# Altium schematic sheet Stepper_Driver_Sheet.SchDoc
size 420 x 297 mm; DocumentNumber: 7; SheetNumber: 7
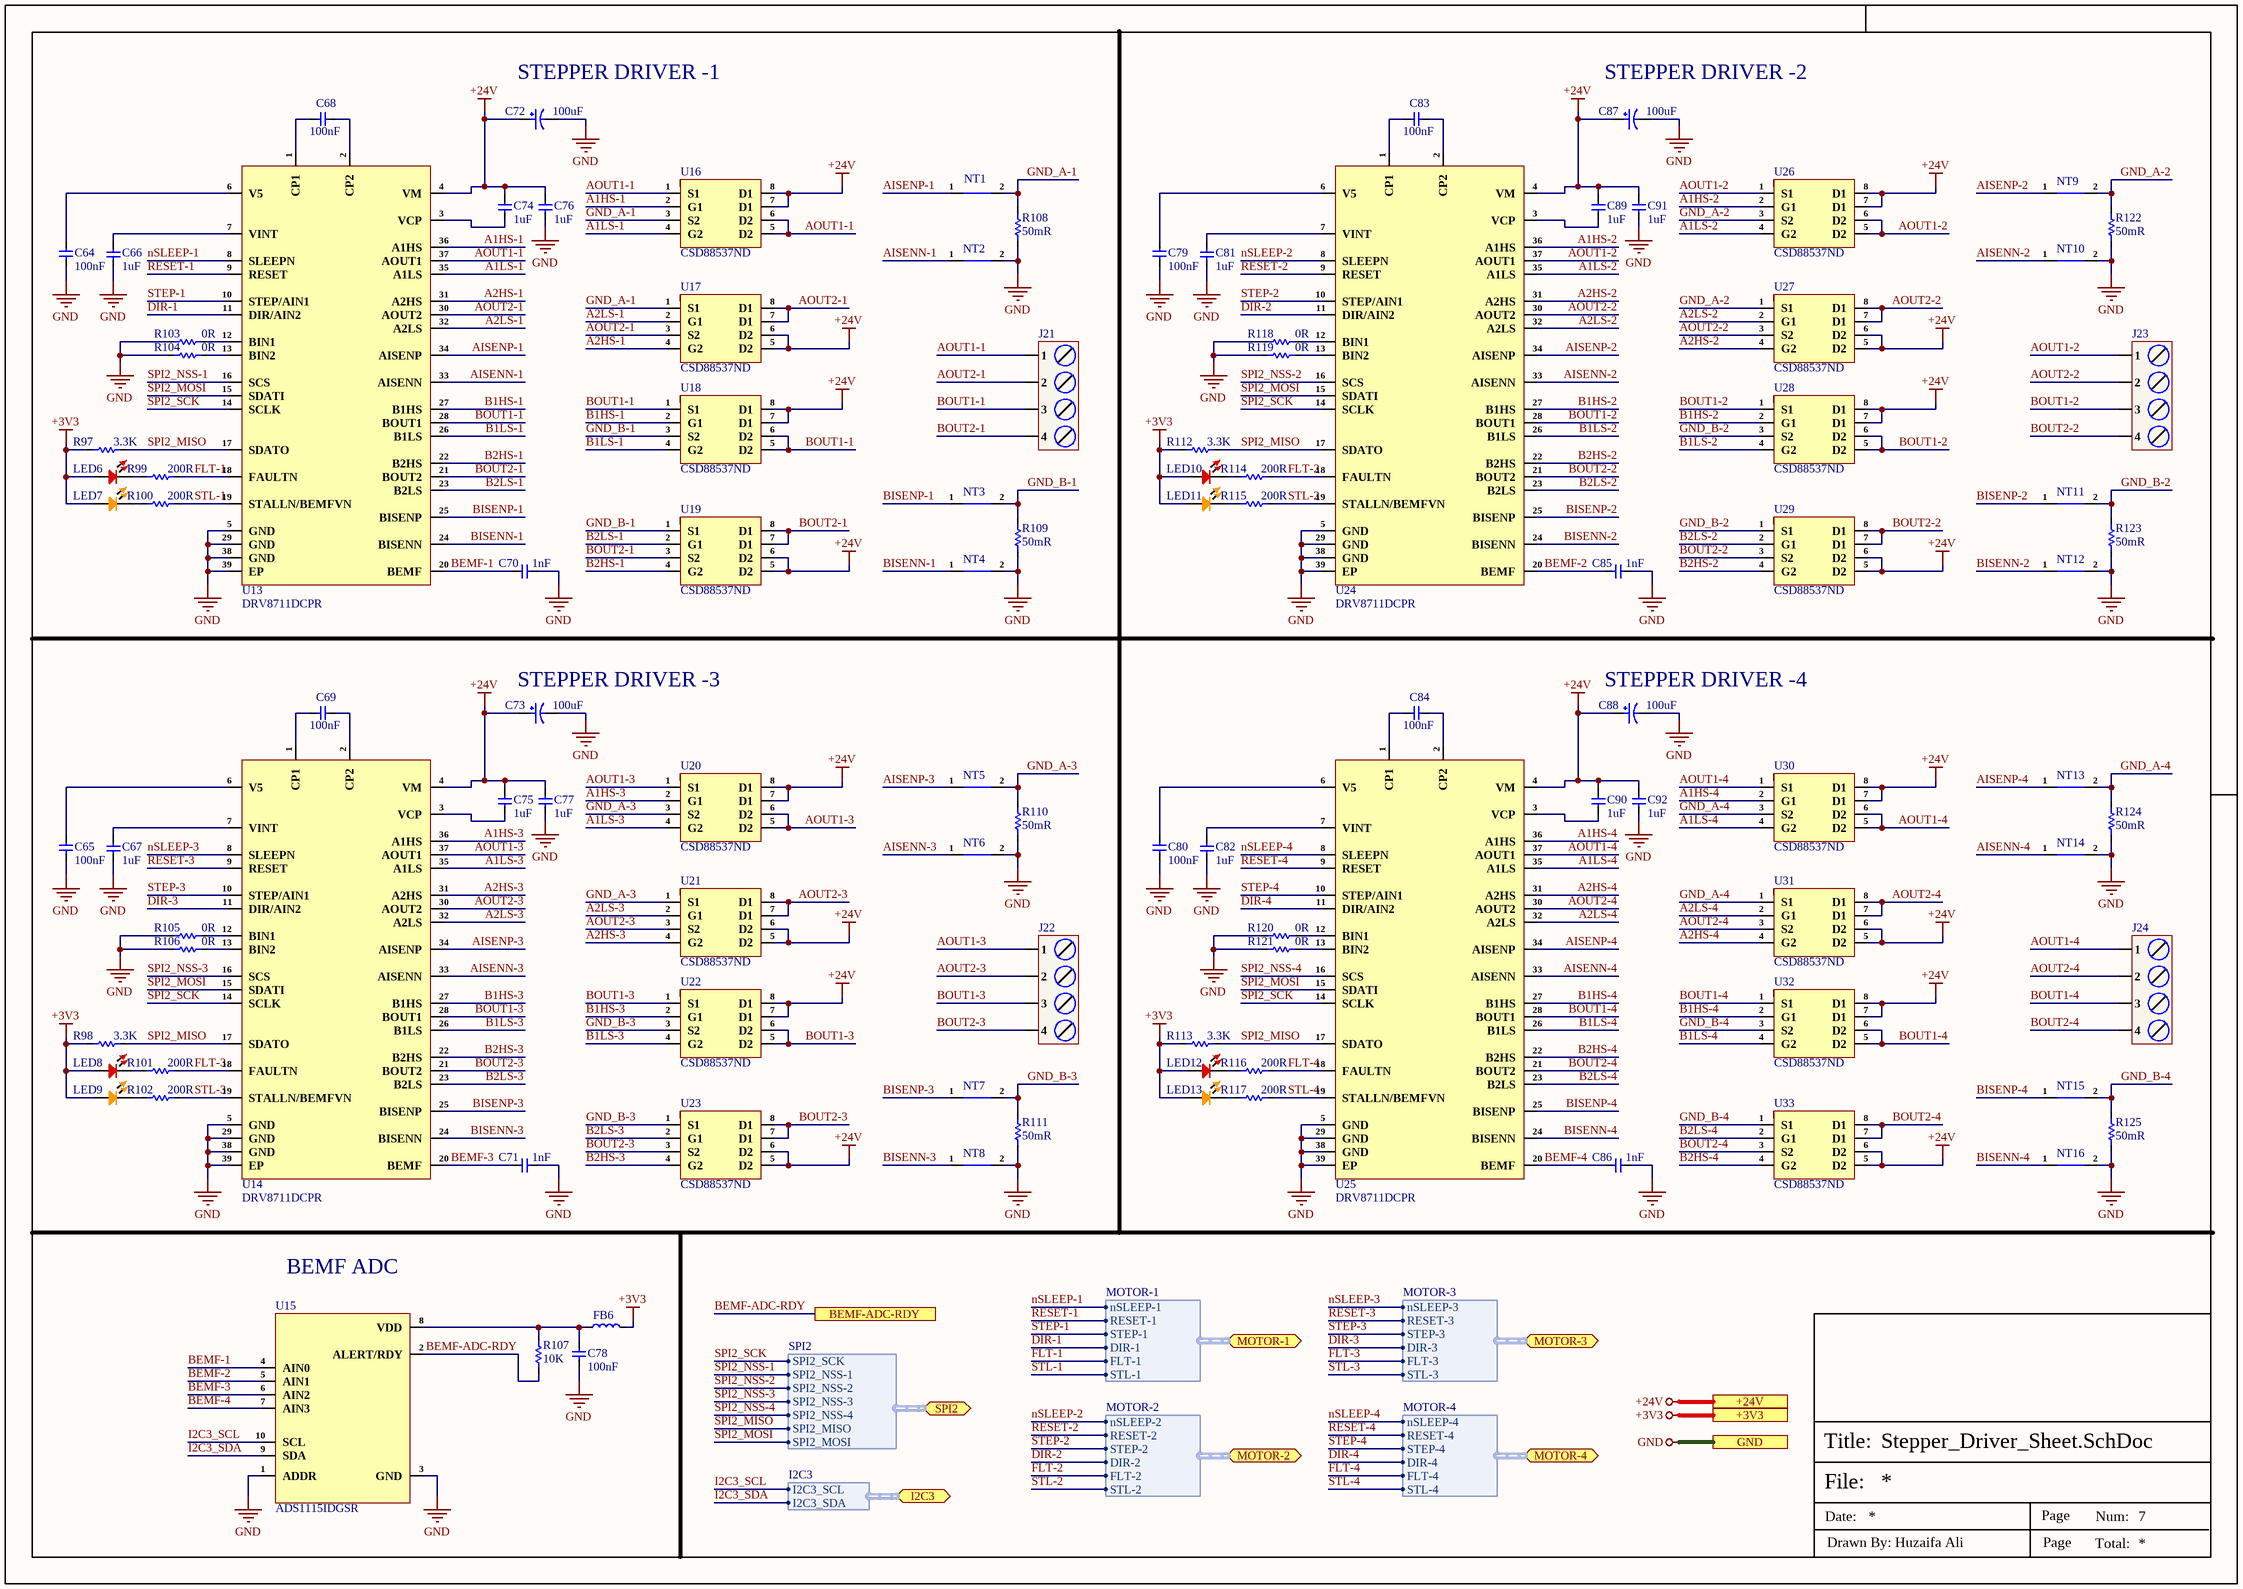
[diagram p0: Stepper_Driver_Sheet.SchDoc]

## Parts
C64  100nF  [cap-0402]
C65  100nF  [cap-0402]
C66  1uF  [Cap-0603]
C67  1uF  [Cap-0603]
C68  100nF  [cap-0402]
C69  100nF  [cap-0402]
C70  1nF  [Cap-0402]
C71  1nF  [Cap-0402]
C72  100uF  [RVT1H101M0607]
C73  100uF  [RVT1H101M0607]
C74  1uF  [Cap-0603]
C75  1uF  [Cap-0603]
C76  1uF  [Cap-0603]
C77  1uF  [Cap-0603]
C78  100nF  [cap-0402]
C79  100nF  [cap-0402]
C80  100nF  [cap-0402]
C81  1uF  [Cap-0603]
C82  1uF  [Cap-0603]
C83  100nF  [cap-0402]
C84  100nF  [cap-0402]
C85  1nF  [Cap-0402]
C86  1nF  [Cap-0402]
C87  100uF  [RVT1H101M0607]
C88  100uF  [RVT1H101M0607]
C89  1uF  [Cap-0603]
C90  1uF  [Cap-0603]
C91  1uF  [Cap-0603]
C92  1uF  [Cap-0603]
FB6  BLM18PG221SN1D  [IND-0603 (1608 Metric)]  (value not drawn)
J21  DB125-3.81-4P-GN-S  [DB125-3.81-4P-GN-S]  (value not drawn)
J22  DB125-3.81-4P-GN-S  [DB125-3.81-4P-GN-S]  (value not drawn)
J23  DB125-3.81-4P-GN-S  [DB125-3.81-4P-GN-S]  (value not drawn)
J24  DB125-3.81-4P-GN-S  [DB125-3.81-4P-GN-S]  (value not drawn)
LED6  RED  [LED-0603]  (value not drawn)
LED7  NCD0603O2  [LED-0603]  (value not drawn)
LED8  RED  [LED-0603]  (value not drawn)
LED9  NCD0603O2  [LED-0603]  (value not drawn)
LED10  RED  [LED-0603]  (value not drawn)
LED11  NCD0603O2  [LED-0603]  (value not drawn)
LED12  RED  [LED-0603]  (value not drawn)
LED13  NCD0603O2  [LED-0603]  (value not drawn)
NT1  Net Tie_SMD  [Net Tie Pad]  (value not drawn)  (net tie, no BOM)
NT2  Net Tie_SMD  [Net Tie Pad]  (value not drawn)  (net tie, no BOM)
NT3  Net Tie_SMD  [Net Tie Pad]  (value not drawn)  (net tie, no BOM)
NT4  Net Tie_SMD  [Net Tie Pad]  (value not drawn)  (net tie, no BOM)
NT5  Net Tie_SMD  [Net Tie Pad]  (value not drawn)  (net tie, no BOM)
NT6  Net Tie_SMD  [Net Tie Pad]  (value not drawn)  (net tie, no BOM)
NT7  Net Tie_SMD  [Net Tie Pad]  (value not drawn)  (net tie, no BOM)
NT8  Net Tie_SMD  [Net Tie Pad]  (value not drawn)  (net tie, no BOM)
NT9  Net Tie_SMD  [Net Tie Pad]  (value not drawn)  (net tie, no BOM)
NT10  Net Tie_SMD  [Net Tie Pad]  (value not drawn)  (net tie, no BOM)
NT11  Net Tie_SMD  [Net Tie Pad]  (value not drawn)  (net tie, no BOM)
NT12  Net Tie_SMD  [Net Tie Pad]  (value not drawn)  (net tie, no BOM)
NT13  Net Tie_SMD  [Net Tie Pad]  (value not drawn)  (net tie, no BOM)
NT14  Net Tie_SMD  [Net Tie Pad]  (value not drawn)  (net tie, no BOM)
NT15  Net Tie_SMD  [Net Tie Pad]  (value not drawn)  (net tie, no BOM)
NT16  Net Tie_SMD  [Net Tie Pad]  (value not drawn)  (net tie, no BOM)
R97  3.3K  [Res-0402]
R98  3.3K  [Res-0402]
R99  200R  [Res-0402]
R100  200R  [Res-0402]
R101  200R  [Res-0402]
R102  200R  [Res-0402]
R103  0R  [Res-0402]
R104  0R  [Res-0402]
R105  0R  [Res-0402]
R106  0R  [Res-0402]
R107  10K  [Res-0402]
R108  50mR  [RES-2010]
R109  50mR  [RES-2010]
R110  50mR  [RES-2010]
R111  50mR  [RES-2010]
R112  3.3K  [Res-0402]
R113  3.3K  [Res-0402]
R114  200R  [Res-0402]
R115  200R  [Res-0402]
R116  200R  [Res-0402]
R117  200R  [Res-0402]
R118  0R  [Res-0402]
R119  0R  [Res-0402]
R120  0R  [Res-0402]
R121  0R  [Res-0402]
R122  50mR  [RES-2010]
R123  50mR  [RES-2010]
R124  50mR  [RES-2010]
R125  50mR  [RES-2010]
U13  DRV8711DCPR  [HTSSOP-38-EP-4.4mm]
U14  DRV8711DCPR  [HTSSOP-38-EP-4.4mm]
U15  ADS1115IDGSR  [VSSOP-10]
U16  CSD88537ND  [SOIC-8]
U17  CSD88537ND  [SOIC-8]
U18  CSD88537ND  [SOIC-8]
U19  CSD88537ND  [SOIC-8]
U20  CSD88537ND  [SOIC-8]
U21  CSD88537ND  [SOIC-8]
U22  CSD88537ND  [SOIC-8]
U23  CSD88537ND  [SOIC-8]
U24  DRV8711DCPR  [HTSSOP-38-EP-4.4mm]
U25  DRV8711DCPR  [HTSSOP-38-EP-4.4mm]
U26  CSD88537ND  [SOIC-8]
U27  CSD88537ND  [SOIC-8]
U28  CSD88537ND  [SOIC-8]
U29  CSD88537ND  [SOIC-8]
U30  CSD88537ND  [SOIC-8]
U31  CSD88537ND  [SOIC-8]
U32  CSD88537ND  [SOIC-8]
U33  CSD88537ND  [SOIC-8]

## Ports
+3V3 (see Top-Sheet[1B], CAN_Sheet[5D], Controller_Sheet[5D], EtherCAT_Sheet[5D], Power_Sheet[5D], RS485_RS232_Sheet[2D]), +24V (see Top-Sheet[1B], Ext_Stepper_Driver_Sheet[5D], Power_Sheet[5D]), BEMF-ADC-RDY (see Top-Sheet[2B], Controller_Sheet[5D]), GND (see Top-Sheet[1B], CAN_Sheet[5D], Controller_Sheet[5D], EtherCAT_Sheet[5D], Ext_Stepper_Driver_Sheet[5D], Power_Sheet[5D], RS485_RS232_Sheet[2D]), I2C3 (bidir, harness I2C3, see Top-Sheet[2B], Controller_Sheet[1C]), MOTOR-1 (bidir, harness MOTOR-1, see Top-Sheet[2B], Controller_Sheet[1D]), MOTOR-2 (bidir, harness MOTOR-2, see Top-Sheet[2B], Controller_Sheet[1D]), MOTOR-3 (bidir, harness MOTOR-3, see Top-Sheet[2B], Controller_Sheet[2D]), MOTOR-4 (bidir, harness MOTOR-4, see Top-Sheet[2B], Controller_Sheet[2D]), SPI2 (bidir, harness SPI2, see Top-Sheet[2B], Controller_Sheet[1D])

## Harnesses
I2C3: I2C3_SCL, I2C3_SDA
SPI2: SPI2_NSS-2, SPI2_NSS-3, SPI2_NSS-4, SPI2_SCK, SPI2_MOSI, SPI2_MISO, SPI2_NSS-1
MOTOR-1: nSLEEP-1, RESET-1, STEP-1, DIR-1, FLT-1, STL-1
MOTOR-2: nSLEEP-2, RESET-2, STEP-2, DIR-2, FLT-2, STL-2
MOTOR-3: nSLEEP-3, RESET-3, STEP-3, DIR-3, FLT-3, STL-3
MOTOR-4: nSLEEP-4, RESET-4, STEP-4, DIR-4, FLT-4, STL-4

## Nets
+3V3: FB6.2 LED6.1 LED7.1 LED8.1 LED9.1 LED10.1 LED11.1 LED12.1 LED13.1 R97.1 R98.1 R112.1 R113.1 ; port +3V3
+24V: C72.1 C73.1 C74.2 C75.2 C76.2 C77.2 C87.1 C88.1 C89.2 C90.2 C91.2 C92.2 U13.4(VM) U14.4(VM) U16.7(D1) U16.8(D1) U17.5(D2) U17.6(D2) U18.7(D1) U18.8(D1) U19.5(D2) U19.6(D2) U20.7(D1) U20.8(D1) U21.5(D2) U21.6(D2) U22.7(D1) U22.8(D1) U23.5(D2) U23.6(D2) U24.4(VM) U25.4(VM) U26.7(D1) U26.8(D1) U27.5(D2) U27.6(D2) U28.7(D1) U28.8(D1) U29.5(D2) U29.6(D2) U30.7(D1) U30.8(D1) U31.5(D2) U31.6(D2) U32.7(D1) U32.8(D1) U33.5(D2) U33.6(D2) ; port +24V
GND: C64.2 C65.2 C66.1 C67.1 C70.2 C71.2 C72.2 C73.2 C76.1 C77.1 C78.2 C79.2 C80.2 C81.1 C82.1 C85.2 C86.2 C87.2 C88.2 C91.1 C92.1 NT2.2 NT4.2 NT6.2 NT8.2 NT10.2 NT12.2 NT14.2 NT16.2 R103.1 R104.1 R105.1 R106.1 R108.1 R109.1 R110.1 R111.1 R118.1 R119.1 R120.1 R121.1 R122.1 R123.1 R124.1 R125.1 U13.5(GND) U13.29(GND) U13.38(GND) U13.39(EP) U14.5(GND) U14.29(GND) U14.38(GND) U14.39(EP) U15.1(ADDR) U15.3(GND) U24.5(GND) U24.29(GND) U24.38(GND) U24.39(EP) U25.5(GND) U25.29(GND) U25.38(GND) U25.39(EP) ; port GND
A1HS-1: U13.36(A1HS) U16.2(G1)
A1HS-2: U24.36(A1HS) U26.2(G1)
A1HS-3: U14.36(A1HS) U20.2(G1)
A1HS-4: U25.36(A1HS) U30.2(G1)
A1LS-1: U13.35(A1LS) U16.4(G2)
A1LS-2: U24.35(A1LS) U26.4(G2)
A1LS-3: U14.35(A1LS) U20.4(G2)
A1LS-4: U25.35(A1LS) U30.4(G2)
A2HS-1: U13.31(A2HS) U17.4(G2)
A2HS-2: U24.31(A2HS) U27.4(G2)
A2HS-3: U14.31(A2HS) U21.4(G2)
A2HS-4: U25.31(A2HS) U31.4(G2)
A2LS-1: U13.32(A2LS) U17.2(G1)
A2LS-2: U24.32(A2LS) U27.2(G1)
A2LS-3: U14.32(A2LS) U21.2(G1)
A2LS-4: U25.32(A2LS) U31.2(G1)
AISENN-1: NT2.1 U13.33(AISENN)
AISENN-2: NT10.1 U24.33(AISENN)
AISENN-3: NT6.1 U14.33(AISENN)
AISENN-4: NT14.1 U25.33(AISENN)
AISENP-1: NT1.1 U13.34(AISENP)
AISENP-2: NT9.1 U24.34(AISENP)
AISENP-3: NT5.1 U14.34(AISENP)
AISENP-4: NT13.1 U25.34(AISENP)
AOUT1-1: J21.1 U13.37(AOUT1) U16.1(S1) U16.5(D2) U16.6(D2)
AOUT1-2: J23.1 U24.37(AOUT1) U26.1(S1) U26.5(D2) U26.6(D2)
AOUT1-3: J22.1 U14.37(AOUT1) U20.1(S1) U20.5(D2) U20.6(D2)
AOUT1-4: J24.1 U25.37(AOUT1) U30.1(S1) U30.5(D2) U30.6(D2)
AOUT2-1: J21.2 U13.30(AOUT2) U17.3(S2) U17.7(D1) U17.8(D1)
AOUT2-2: J23.2 U24.30(AOUT2) U27.3(S2) U27.7(D1) U27.8(D1)
AOUT2-3: J22.2 U14.30(AOUT2) U21.3(S2) U21.7(D1) U21.8(D1)
AOUT2-4: J24.2 U25.30(AOUT2) U31.3(S2) U31.7(D1) U31.8(D1)
B1HS-1: U13.27(B1HS) U18.2(G1)
B1HS-2: U24.27(B1HS) U28.2(G1)
B1HS-3: U14.27(B1HS) U22.2(G1)
B1HS-4: U25.27(B1HS) U32.2(G1)
B1LS-1: U13.26(B1LS) U18.4(G2)
B1LS-2: U24.26(B1LS) U28.4(G2)
B1LS-3: U14.26(B1LS) U22.4(G2)
B1LS-4: U25.26(B1LS) U32.4(G2)
B2HS-1: U13.22(B2HS) U19.4(G2)
B2HS-2: U24.22(B2HS) U29.4(G2)
B2HS-3: U14.22(B2HS) U23.4(G2)
B2HS-4: U25.22(B2HS) U33.4(G2)
B2LS-1: U13.23(B2LS) U19.2(G1)
B2LS-2: U24.23(B2LS) U29.2(G1)
B2LS-3: U14.23(B2LS) U23.2(G1)
B2LS-4: U25.23(B2LS) U33.2(G1)
BEMF-1: C70.1 U13.20(BEMF) U15.4(AIN0)
BEMF-2: C85.1 U15.5(AIN1) U24.20(BEMF)
BEMF-3: C71.1 U14.20(BEMF) U15.6(AIN2)
BEMF-4: C86.1 U15.7(AIN3) U25.20(BEMF)
BEMF-ADC-RDY: R107.2 U15.2(ALERT/RDY) ; port BEMF-ADC-RDY
BISENN-1: NT4.1 U13.24(BISENN)
BISENN-2: NT12.1 U24.24(BISENN)
BISENN-3: NT8.1 U14.24(BISENN)
BISENN-4: NT16.1 U25.24(BISENN)
BISENP-1: NT3.1 U13.25(BISENP)
BISENP-2: NT11.1 U24.25(BISENP)
BISENP-3: NT7.1 U14.25(BISENP)
BISENP-4: NT15.1 U25.25(BISENP)
BOUT1-1: J21.3 U13.28(BOUT1) U18.1(S1) U18.5(D2) U18.6(D2)
BOUT1-2: J23.3 U24.28(BOUT1) U28.1(S1) U28.5(D2) U28.6(D2)
BOUT1-3: J22.3 U14.28(BOUT1) U22.1(S1) U22.5(D2) U22.6(D2)
BOUT1-4: J24.3 U25.28(BOUT1) U32.1(S1) U32.5(D2) U32.6(D2)
BOUT2-1: J21.4 U13.21(BOUT2) U19.3(S2) U19.7(D1) U19.8(D1)
BOUT2-2: J23.4 U24.21(BOUT2) U29.3(S2) U29.7(D1) U29.8(D1)
BOUT2-3: J22.4 U14.21(BOUT2) U23.3(S2) U23.7(D1) U23.8(D1)
BOUT2-4: J24.4 U25.21(BOUT2) U33.3(S2) U33.7(D1) U33.8(D1)
DIR-1: U13.11(DIR/AIN2) ; port MOTOR-1.DIR-1
DIR-2: U24.11(DIR/AIN2) ; port MOTOR-2.DIR-2
DIR-3: U14.11(DIR/AIN2) ; port MOTOR-3.DIR-3
DIR-4: U25.11(DIR/AIN2) ; port MOTOR-4.DIR-4
FLT-1: R99.2 U13.18(FAULTN) ; port MOTOR-1.FLT-1
FLT-2: R114.2 U24.18(FAULTN) ; port MOTOR-2.FLT-2
FLT-3: R101.2 U14.18(FAULTN) ; port MOTOR-3.FLT-3
FLT-4: R116.2 U25.18(FAULTN) ; port MOTOR-4.FLT-4
GND_A-1: NT1.2 R108.2 U16.3(S2) U17.1(S1)
GND_A-2: NT9.2 R122.2 U26.3(S2) U27.1(S1)
GND_A-3: NT5.2 R110.2 U20.3(S2) U21.1(S1)
GND_A-4: NT13.2 R124.2 U30.3(S2) U31.1(S1)
GND_B-1: NT3.2 R109.2 U18.3(S2) U19.1(S1)
GND_B-2: NT11.2 R123.2 U28.3(S2) U29.1(S1)
GND_B-3: NT7.2 R111.2 U22.3(S2) U23.1(S1)
GND_B-4: NT15.2 R125.2 U32.3(S2) U33.1(S1)
I2C3_SCL: U15.10(SCL) ; port I2C3.I2C3_SCL
I2C3_SDA: U15.9(SDA) ; port I2C3.I2C3_SDA
nSLEEP-1: U13.8(SLEEPN) ; port MOTOR-1.nSLEEP-1
nSLEEP-2: U24.8(SLEEPN) ; port MOTOR-2.nSLEEP-2
nSLEEP-3: U14.8(SLEEPN) ; port MOTOR-3.nSLEEP-3
nSLEEP-4: U25.8(SLEEPN) ; port MOTOR-4.nSLEEP-4
RESET-1: U13.9(RESET) ; port MOTOR-1.RESET-1
RESET-2: U24.9(RESET) ; port MOTOR-2.RESET-2
RESET-3: U14.9(RESET) ; port MOTOR-3.RESET-3
RESET-4: U25.9(RESET) ; port MOTOR-4.RESET-4
SPI2_MISO: R97.2 R98.2 R112.2 R113.2 U13.17(SDATO) U14.17(SDATO) U24.17(SDATO) U25.17(SDATO) ; port SPI2.SPI2_MISO
SPI2_MOSI: U13.15(SDATI) U14.15(SDATI) U24.15(SDATI) U25.15(SDATI) ; port SPI2.SPI2_MOSI
SPI2_NSS-1: U13.16(SCS) ; port SPI2.SPI2_NSS-1
SPI2_NSS-2: U24.16(SCS) ; port SPI2.SPI2_NSS-2
SPI2_NSS-3: U14.16(SCS) ; port SPI2.SPI2_NSS-3
SPI2_NSS-4: U25.16(SCS) ; port SPI2.SPI2_NSS-4
SPI2_SCK: U13.14(SCLK) U14.14(SCLK) U24.14(SCLK) U25.14(SCLK) ; port SPI2.SPI2_SCK
STEP-1: U13.10(STEP/AIN1) ; port MOTOR-1.STEP-1
STEP-2: U24.10(STEP/AIN1) ; port MOTOR-2.STEP-2
STEP-3: U14.10(STEP/AIN1) ; port MOTOR-3.STEP-3
STEP-4: U25.10(STEP/AIN1) ; port MOTOR-4.STEP-4
STL-1: R100.2 U13.19(STALLN/BEMFVN) ; port MOTOR-1.STL-1
STL-2: R115.2 U24.19(STALLN/BEMFVN) ; port MOTOR-2.STL-2
STL-3: R102.2 U14.19(STALLN/BEMFVN) ; port MOTOR-3.STL-3
STL-4: R117.2 U25.19(STALLN/BEMFVN) ; port MOTOR-4.STL-4
NetC64_1: C64.1 U13.6(V5)
NetC65_1: C65.1 U14.6(V5)
NetC66_2: C66.2 U13.7(VINT)
NetC67_2: C67.2 U14.7(VINT)
NetC68_1: C68.1 U13.2(CP2)
NetC68_2: C68.2 U13.1(CP1)
NetC69_1: C69.1 U14.2(CP2)
NetC69_2: C69.2 U14.1(CP1)
NetC74_1: C74.1 U13.3(VCP)
NetC75_1: C75.1 U14.3(VCP)
NetC78_1: C78.1 FB6.1 R107.1 U15.8(VDD)
NetC79_1: C79.1 U24.6(V5)
NetC80_1: C80.1 U25.6(V5)
NetC81_2: C81.2 U24.7(VINT)
NetC82_2: C82.2 U25.7(VINT)
NetC83_1: C83.1 U24.2(CP2)
NetC83_2: C83.2 U24.1(CP1)
NetC84_1: C84.1 U25.2(CP2)
NetC84_2: C84.2 U25.1(CP1)
NetC89_1: C89.1 U24.3(VCP)
NetC90_1: C90.1 U25.3(VCP)
NetLED6_2: LED6.2 R99.1
NetLED7_2: LED7.2 R100.1
NetLED8_2: LED8.2 R101.1
NetLED9_2: LED9.2 R102.1
NetLED10_2: LED10.2 R114.1
NetLED11_2: LED11.2 R115.1
NetLED12_2: LED12.2 R116.1
NetLED13_2: LED13.2 R117.1
NetR103_2: R103.2 U13.12(BIN1)
NetR104_2: R104.2 U13.13(BIN2)
NetR105_2: R105.2 U14.12(BIN1)
NetR106_2: R106.2 U14.13(BIN2)
NetR118_2: R118.2 U24.12(BIN1)
NetR119_2: R119.2 U24.13(BIN2)
NetR120_2: R120.2 U25.12(BIN1)
NetR121_2: R121.2 U25.13(BIN2)

## Notes on the sheet
- (near C72) STEPPER DRIVER -1
- (near C87) STEPPER DRIVER -2
- (near C73) STEPPER DRIVER -3
- (near C88) STEPPER DRIVER -4
- (near U15) BEMF ADC
- File:
- Title:
- Date:
- Page
- Num:
- Total:
- Drawn By: Huzaifa Ali

## Library data of the parts
C64 C65 C68 C69 C78-C80 C83 C84 = C1005X7R1H104KT000F: CAP CER 0.1UF 50V X7R 0402; Manufacturer: TDK; Tolerance: 10%; Voltage: 25V; Item Type: Capacitor; Supplier 1: Avnet; Manufacturer Part Number: C1005X7R1H104KT000F; RoHS: No; Category: Ceramic Capacitors; Dielectric: X7R; Supplier Part Number 1: C1005X7R1H104KT000F; LCSC Part Number: C361198; ComponentLink1Description: LCSC; ComponentLink1URL: https://www.lcsc.com/product-detail/Multilayer-Ceramic-Capacitors-MLCC-SMD-SMT_TDK-C1005X7R1H104KT000F_C361198.html
C66 C67 C74-C77 C81 C82 C89-C92 = CL10A105KB8NNNC: CAP CER 1UF 50V X5R 0603; Manufacturer: Samsung; Material: 4241ConductorMaterial; Tolerance: 10%; Item Type: Capacitor; Supplier: Avnet; Supplier Part Number: CL10A105KB8NNNC; Manufacturer Part Number: CL10A105KB8NNNC; RoHS: Yes; Category: Ceramic Capacitors; Stock: 780446; Pricing: 4000=0.01632, 8000=0.01595, 16000=0.01557, 24000=0.0152, 32000=0.01482 (USD); Mounting Technology: Surface Mount; Case/Package: 0603; Case Code (Metric): 1608; Case Code (Imperial): 0603; Min Operating Temperature: -55°C; Max Operating Temperature: 85°C; Packaging: Tape and Reel; Value: 1uF; Voltage Rating: 50V; Dielectric: X5R; Series: CL; Voltage Rating (DC): 50V; Length: 1.6mm; Depth: 0.8mm; Radiation Hardening: No; RoHS Compliant: Yes; ComponentLink1URL: https://datasheet.ciiva.com/26877/getdatasheetpartid-753736-26877879.pdf?src-supplier=Verical; ComponentLink1Description: https://datasheet.ciiva.com/26877/getdatasheetpartid-753736-26877879.pdf?src-supplier=Verical; LCSC Part Number: C15849
C70 C71 C85 C86 = C1005C0G1E102JT000F: CAP CER 1000PF 25V C0G 0402; Manufacturer: TDK; Item Type: Capacitor; ComponentLink1Description: LCSC; ComponentLink1URL: https://www.lcsc.com/product-detail/Multilayer-Ceramic-Capacitors-MLCC-SMD-SMT_TDK-C1005C0G1E102JT000F_C343059.html; Manufacturer Part Number: C1005C0G1E102JT000F; Package: 0402; LCSC Part Number: C343059
C72 C73 C87 C88 = RVT1H101M0607: 100uF 50V ±20% SMD,D6.3xL7.7mm Aluminum Electrolytic Capacitors - SMD ROHS; Manufacturer: ROQANG; Manufacturer Part Number: RVT1H101M0607; Package: SMD,D6.3xL7.7mm; LCSC Part Number: C3151829; Item Type: Capacitor; ComponentLink1Description: LCSC; ComponentLink1URL: https://www.lcsc.com/product-detail/Aluminum-Electrolytic-Capacitors-SMD_ROQANG-RVT1H101M0607_C3151829.html
FB6 = BLM18PG221SN1D: FERRITE BEAD 220 OHM 0603 1LN; Manufacturer: Murata; Manufacturer Series: BLM18P; Material: Steel,Ferrite; Value: 100mR; Impedance: 220R; Tolerance: 25%; Current Rating: 1.4A; Number of Lines: 1; Test Frequency: 100MHz; Shielding: Unshielded; Supplier: Digikey; LCSC Part Number: C80165; Manufacturer Part Number: BLM18PG221SN1D; RoHS: Yes; Item Type: Ferrite Bead; Stock: 134052; Pricing: 1=0.1, 10=0.078, 25=0.0712, 50=0.064, 100=0.0469, 250=0.03412, 500=0.03128, 1000=0.02701 (USD); Case/Package: 0603; Pins: 2; Core Material: Ferrite; Case Code (Metric): 1608; Case Code (Imperial): 0603; Weight: 7.1E-05oz; Min Operating Temperature: -55°C; Max Operating Temperature: 125°C; Package Quantity: 1; Packaging: Tape and Reel; ESR (Equivalent Series Resistance): 220R; Max Current Rating: 1.4A; DC Resistance (DCR): 100mR; Termination: SMD/SMT; Max DC Current: 1.4A; DC Current: 1.4A; Number of Circuits: 1; Series: BLM18P; Channels: 1; DC Resistance-Max: 100mR; RMS Current (Irms): 1.4A; ESR: 100mR; Length: 1.6mm; Width: 0.8mm; Height: 0.8mm; Depth: 0.8mm; Radiation Hardening: No; Reach SVHC Compliant: No; Lead Free: Lead Free; RoHS Compliant: Yes; ComponentLink1URL: https://datasheet.ciiva.com/19458/1845030-19458417.pdf?src-supplier=Jameco; ComponentLink1Description: https://datasheet.ciiva.com/19458/1845030-19458417.pdf?src-supplier=Jameco; ComponentLink2URL: https://datasheet.ciiva.com/11800/0900766b81275ca5-11800851.pdf?src-supplier=Rs; ComponentLink2Description: https://datasheet.ciiva.com/11800/0900766b81275ca5-11800851.pdf?src-supplier=Rs; ComponentLink3URL: https://datasheet.ciiva.com/29347/442391-da-01-en-chip-drossel-0603-220r-1400ma-1-6x0-8mm-29347986.pdf?src-supplier=Conrad; ComponentLink3Description: https://datasheet.ciiva.com/29347/442391-da-01-en-chip-drossel-0603-220r-1400ma-1-6x0-8mm-29347986.pdf?src-supplier=Conrad; ComponentLink4URL: https://datasheet.ciiva.com/8021/5148-8021482.pdf?src-supplier=Element14; ComponentLink4Description: https://datasheet.ciiva.com/8021/5148-8021482.pdf?src-supplier=Element14; ComponentLink5URL: https://datasheet.ciiva.com/8021/5148-8021479.pdf?src-supplier=Element14; ComponentLink5Description: https://datasheet.ciiva.com/8021/5148-8021479.pdf?src-supplier=Element14; ComponentLink6URL: https://datasheet.ciiva.com/14122/blm-series-eng-tds-14122909.pdf?src-supplier=Distrelec; ComponentLink6Description: https://datasheet.ciiva.com/14122/blm-series-eng-tds-14122909.pdf?src-supplier=Distrelec; ComponentLink7URL: https://datasheet.ciiva.com/1012/l0110s0100blm18p-1012162.pdf?src-supplier=Digikey; ComponentLink7Description: https://datasheet.ciiva.com/1012/l0110s0100blm18p-1012162.pdf?src-supplier=Digikey; ComponentLink8URL: https://datasheet.ciiva.com/1012/l0110s0100blm18p-1012161.pdf?src-supplier=Digikey; ComponentLink8Description: https://datasheet.ciiva.com/1012/l0110s0100blm18p-1012161.pdf?src-supplier=Digikey; ComponentLink9URL: https://datasheet.ciiva.com/1012/l0110s0100blm18p-1012163.pdf?src-supplier=Digikey; ComponentLink9Description: https://datasheet.ciiva.com/1012/l0110s0100blm18p-1012163.pdf?src-supplier=Digikey; ComponentLink10URL: https://datasheet.ciiva.com/3081/l0110s0100blm18p-3081633.pdf?src-supplier=Avnet; ComponentLink10Description: https://datasheet.ciiva.com/3081/l0110s0100blm18p-3081633.pdf?src-supplier=Avnet; ComponentLink11URL: https://datasheet.ciiva.com/16205/l0110s0100blm18p-16205422.pdf?src-supplier=Future+Electronics; ComponentLink11Description: https://datasheet.ciiva.com/16205/l0110s0100blm18p-16205422.pdf?src-supplier=Future+Electronics
J21-J24 = DB125-3.81-4P-GN-S: 1x4P 10A -40℃~+105℃ 300V Green 16~26 Straight 3.81mm 0.5~1 1 4 Plugin,P=3.81mm Screw terminal ROHS; Manufacturer: DORABO; Item Type: Terminal Block; Manufacturer Part Number: DB125-3.81-4P-GN-S; Package: Plugin,P=3.81mm; LCSC Part Number: C395880; ComponentLink1Description: LCSC; ComponentLink1URL: https://www.lcsc.com/product-detail/Screw-terminal_DORABO-DB125-3-81-4P-GN-S_C395880.html
LED6 LED8 LED10 LED12 = NCD0603R3: RED LED 0603 Light Emitting Diodes; Manufacturer: Foshan NationStar Optoelectronics; Manufacturer Part Number: NCD0603R3; Package: 0603; Item Type: LED; LCSC Part Number: C3151730; ComponentLink1Description: LCSC; ComponentLink1URL: https://www.lcsc.com/product-detail/Light-Emitting-Diodes-LED_Foshan-NationStar-Optoelectronics-NCD0603R3_C3151730.html
LED7 LED9 LED11 LED13 = NCD0603O2: 20mA 100mcd~220mcd 600nm~610nm -30℃~+85℃ Orange 130° 65mW 1.6V~2.6V 0603 Light Emitting Diodes (LED) ROHS; Manufacturer: FOSHAN Nationstar Optoelectronics; Supplier: LCSC; LCSC Part Number: C108553; Manufacturer Part Number: NCD0603O2; RoHS: No; Item Type: LED
NT1-NT16 = Net Tie_SMD: Net Tie SMD; Manufacturer Part Number: Net Tie; Item Type: Net Tie Pad
R97 R98 R112 R113 = RC0402FR-073K3L: RES 3.3K OHM 1% 1/16W 0402; Manufacturer: Yageo; Resistance: 3.3kR; Power Rating: 62.5mW; Voltage Rating: 50V; Temperature Coefficient: 100ppm/°C; Max Power Dissipation: 63mW; Item Type: Resistor; Supplier 1: Mouser; Manufacturer Part Number: RC0402FR-073K3L; RoHS: Yes; Category: Chip SMD Resistors; Stock 1: 2413047; Pricing 1: 1=0.10000, 10=0.01400, 50=0.01400, 100=0.00600, 1000=0.00300, 5000=0.00200, 10000=0.00100 (USD); Case/Package: 0402; Number of Pins: 2; Case Code (Imperial): 0402; Case Code (Metric): 1005; Size Code: 0402; Min Operating Temperature: -55°C; Max Operating Temperature: 155°C; Tolerance: 1%; Voltage Rating (DC): 50V; Packaging: Tape and Reel; Package Quantity: 1; Termination: SMD/SMT; Resistor Type: Thick Film; Number of Terminations: 2; Features: Moisture Resistant; Series: RC; Resistance Tolerance: 1%; Technology: THICK FILM; Construction: Rectangular; Length: 1mm; Width: 0.5mm; Height: 0.016inch; Depth: 0.5mm; RoHS Compliant: Yes; REACH SVHC: No SVHC; Military Standard: Not; Lead Free: Lead Free; ComponentLink1URL: https://datasheet.ciiva.com/11808/0900766b80c66297-11808441.pdf?src-supplier=RSComponents; ComponentLink1Description: https://datasheet.ciiva.com/11808/0900766b80c66297-11808441.pdf?src-supplier=RSComponents; ComponentLink2URL: https://datasheet.ciiva.com/46394/1018594-46394940.pdf?src-supplier=Element14; ComponentLink2Description: https://datasheet.ciiva.com/46394/1018594-46394940.pdf?src-supplier=Element14; ComponentLink3URL: https://datasheet.ciiva.com/2453/pyu-r-int-thick-7-2453395.pdf?src-supplier=Digi-Key; ComponentLink3Description: https://datasheet.ciiva.com/2453/pyu-r-int-thick-7-2453395.pdf?src-supplier=Digi-Key; ComponentLink4URL: https://datasheet.ciiva.com/2453/pyu-r-int-thick-7-2453396.pdf?src-supplier=Digi-Key; ComponentLink4Description: https://datasheet.ciiva.com/2453/pyu-r-int-thick-7-2453396.pdf?src-supplier=Digi-Key; ComponentLink5URL: https://datasheet.ciiva.com/2453/pyu-r-int-thick-7-2453394.pdf?src-supplier=Digi-Key; ComponentLink5Description: https://datasheet.ciiva.com/2453/pyu-r-int-thick-7-2453394.pdf?src-supplier=Digi-Key; ComponentLink6URL: https://datasheet.ciiva.com/16746/pyu-rc0402-51-rohs-l-6-r-16746361.pdf?src-supplier=Future+Electronics; ComponentLink6Description: https://datasheet.ciiva.com/16746/pyu-rc0402-51-rohs-l-6-r-16746361.pdf?src-supplier=Future+Electronics; Supplier Part Number 1: 603-RC0402FR-073K3L; LCSC Part Number: C137992
R99-R102 R114-R117 = RC0402FR-07200RL: RES 200 OHM 1% 1/16W 0402; Manufacturer: Yageo; Temperature Coefficient: 100ppm/°C; Power Rating: 63mW; Voltage Rating (DC): 50V; Supplier 1: Digi-Key; Manufacturer Part Number: RC0402FR-07200RL; RoHS: Yes; Category: Chip SMD Resistors; Stock 1: 19778; Pricing 1: 1=0.10000, 10=0.01600, 100=0.00660, 1000=0.00299, 2500=0.00259, 5000=0.00214 (USD); Case/Package: 0402; Case Code (Metric): 1005; Case Code (Imperial): 0402; Size Code: 0402; Min Operating Temperature: -55°C; Max Operating Temperature: 155°C; Tolerance: 1%; Resistance: 200R; Resistor Type: Thick Film; Packaging: Tape and Reel; Voltage Rating: 50V; Package Quantity: 1; Number of Terminations: 2; Termination: SMD/SMT; Max Power Dissipation: 63mW; Features: Moisture Resistant; Series: RC; Construction: Rectangular; Resistance Tolerance: 1%; Length: 1mm; Width: 0.02inch; Height: 0.016inch; Depth: 0.5mm; REACH SVHC: No SVHC; Lead Free: Lead Free; RoHS Compliant: Yes; Military Standard: Not; ComponentLink1URL: https://datasheet.ciiva.com/2553/pyu-r-int-thick-7-2553232.pdf?src-supplier=Digi-Key; ComponentLink1Description: https://datasheet.ciiva.com/2553/pyu-r-int-thick-7-2553232.pdf?src-supplier=Digi-Key; ComponentLink2URL: https://datasheet.ciiva.com/7983/1018594-7983509.pdf?src-supplier=Element14; ComponentLink2Description: https://datasheet.ciiva.com/7983/1018594-7983509.pdf?src-supplier=Element14; ComponentLink3URL: https://datasheet.ciiva.com/16804/pyu-rc0402-51-rohs-l-6-r-16804406.pdf?src-supplier=Future+Electronics; ComponentLink3Description: https://datasheet.ciiva.com/16804/pyu-rc0402-51-rohs-l-6-r-16804406.pdf?src-supplier=Future+Electronics; ComponentLink4URL: https://datasheet.ciiva.com/15189/getdatasheetpartid-331152-15189383.pdf?src-supplier=Verical; ComponentLink4Description: https://datasheet.ciiva.com/15189/getdatasheetpartid-331152-15189383.pdf?src-supplier=Verical; ComponentLink5URL: https://datasheet.ciiva.com/7849/1018594-7849898.pdf?src-supplier=Element14; ComponentLink5Description: https://datasheet.ciiva.com/7849/1018594-7849898.pdf?src-supplier=Element14; ComponentLink6URL: https://datasheet.ciiva.com/5562/pyu-rc0402-51-rohs-l-6-r-8721-5562539.pdf?src-supplier=Mouser; ComponentLink6Description: https://datasheet.ciiva.com/5562/pyu-rc0402-51-rohs-l-6-r-8721-5562539.pdf?src-supplier=Mouser; ComponentLink7URL: https://datasheet.ciiva.com/7849/1018594-7849899.pdf?src-supplier=Element14; ComponentLink7Description: https://datasheet.ciiva.com/7849/1018594-7849899.pdf?src-supplier=Element14; ComponentLink8URL: https://datasheet.ciiva.com/2553/pyu-r-int-thick-7-2553230.pdf?src-supplier=Digi-Key; ComponentLink8Description: https://datasheet.ciiva.com/2553/pyu-r-int-thick-7-2553230.pdf?src-supplier=Digi-Key; ComponentLink9URL: https://datasheet.ciiva.com/2553/pyu-r-int-thick-7-2553231.pdf?src-supplier=Digi-Key; ComponentLink9Description: https://datasheet.ciiva.com/2553/pyu-r-int-thick-7-2553231.pdf?src-supplier=Digi-Key; Supplier Part Number 1: 311-200LRCT-ND; LCSC Part Number: C114764
R103-R106 R118-R121 = RC0402FR-070RL: RES 0 OHM JUMPER 1/16W 0402; Manufacturer: Yageo; Item Type: Resistors; Tolerance: 1%; Power Rating: 62.5mW; Voltage Rating: 50V; Temperature Coefficient: 200ppm/°C; Max Power Dissipation: 63mW; Supplier 1: Mouser; Manufacturer Part Number: RC0402FR-070RL; RoHS: Yes; Stock 1: 8556842; Pricing 1: 1=0.10000, 10=0.01400, 50=0.01400, 100=0.00600, 1000=0.00300, 5000=0.00200, 10000=0.00100 (USD); Mount: Surface Mount; Case/Package: 0402; Contact Plating: Tin,Matte; Case Code (Imperial): 0402; Case Code (Metric): 1005; Size Code: 0402; Min Operating Temperature: -55°C; Max Operating Temperature: 155°C; Resistance: 0R; Resistor Type: Thick Film; Packaging: Tape and Reel; Termination: SMD/SMT; Features: Moisture Resistant; Series: RC; Number of Terminations: 2; Length: 1mm; Width: 0.5mm; Height: 0.35mm; Radiation Hardening: No; Lead Free: Lead Free; RoHS Compliant: Yes; ComponentLink1URL: https://datasheet.ciiva.com/8896/pyu-rc0402-51-rohs-l-6-8896149.pdf?src-supplier=Avnet; ComponentLink1Description: https://datasheet.ciiva.com/8896/pyu-rc0402-51-rohs-l-6-8896149.pdf?src-supplier=Avnet; ComponentLink2URL: https://datasheet.ciiva.com/16790/pyu-rc0402-51-rohs-l-6-r-16790444.pdf?src-supplier=Future+Electronics; ComponentLink2Description: https://datasheet.ciiva.com/16790/pyu-rc0402-51-rohs-l-6-r-16790444.pdf?src-supplier=Future+Electronics; Supplier Part Number 1: 603-RC0402FR-070RL; LCSC Part Number: C106231
R107 = RC0402FR-0710KL: RES 10K OHM 1% 1/16W 0402; Manufacturer: Yageo; Resistance: 10kR; Voltage Rating (DC): 50V; Temperature Coefficient: 100ppm/°C; Power Rating: 62.5mW; Max Power Dissipation: 63mW; Item Type: Resistor; Supplier 1: Mouser; Manufacturer Part Number: RC0402FR-0710KL; RoHS: Yes; Category: Chip SMD Resistors; Stock 1: 18648329; Pricing 1: 1=0.10000, 10=0.01400, 50=0.01400, 100=0.00500, 1000=0.00300, 10000=0.00200 (USD); Case/Package: 0402; Number of Pins: 2; Case Code (Imperial): 0402; Case Code (Metric): 1005; Min Operating Temperature: -55°C; Max Operating Temperature: 155°C; Resistor Type: Thick Film; Tolerance: 1%; Packaging: Tape and Reel; Voltage Rating: 50V; Termination: SMD/SMT; Working Voltage: 50V; Number of Terminations: 2; Features: Moisture Resistant; Series: RC; Resistance Tolerance: 1%; Construction: Rectangular; Length: 1mm; Width: 0.5mm; Height: 0.32mm; Depth: 0.5mm; Lead Pitch: 0.2mm; REACH SVHC: No SVHC; Lead Free: Lead Free; RoHS Compliant: Yes; Military Standard: Not; ComponentLink1URL: https://datasheet.ciiva.com/7660/38568-7660787.pdf?src-supplier=Element14; ComponentLink1Description: https://datasheet.ciiva.com/7660/38568-7660787.pdf?src-supplier=Element14; ComponentLink2URL: https://datasheet.ciiva.com/7849/1686128-7849814.pdf?src-supplier=Element14; ComponentLink2Description: https://datasheet.ciiva.com/7849/1686128-7849814.pdf?src-supplier=Element14; ComponentLink3URL: https://datasheet.ciiva.com/7983/1018594-7983486.pdf?src-supplier=Element14; ComponentLink3Description: https://datasheet.ciiva.com/7983/1018594-7983486.pdf?src-supplier=Element14; ComponentLink4URL: https://datasheet.ciiva.com/22747/1018594-22747512.pdf?src-supplier=Element14; ComponentLink4Description: https://datasheet.ciiva.com/22747/1018594-22747512.pdf?src-supplier=Element14; ComponentLink5URL: https://datasheet.ciiva.com/12667/pyu-rc0402-51-rohs-l-6-r-12667067.pdf?src-supplier=Mouser; ComponentLink5Description: https://datasheet.ciiva.com/12667/pyu-rc0402-51-rohs-l-6-r-12667067.pdf?src-supplier=Mouser; ComponentLink6URL: https://datasheet.ciiva.com/7849/1784430-7849813.pdf?src-supplier=Element14; ComponentLink6Description: https://datasheet.ciiva.com/7849/1784430-7849813.pdf?src-supplier=Element14; ComponentLink7URL: https://datasheet.ciiva.com/7849/1784430-7849815.pdf?src-supplier=Element14; ComponentLink7Description: https://datasheet.ciiva.com/7849/1784430-7849815.pdf?src-supplier=Element14; Supplier Part Number 1: 603-RC0402FR-0710KL; LCSC Part Number: C60490
R108-R111 R122-R125 = RLM20FECR050: 1W 50mΩ Surface Mount Current Sensing Resistors ±50ppm/℃ ±1% 2010 Current Sense Resistors/Shunt Resistors ROHS; Manufacturer: TA-I Tech; Manufacturer Part Number: RLM20FECR050; Package: 2010; LCSC Part Number: C912938; Item Type: Shunt Resistor; ComponentLink1Description: LCSC; ComponentLink1URL: https://www.lcsc.com/product-detail/Current-Sense-Resistors-Shunt-Resistors_TA-I-Tech-RLM20FECR050_C912938.html
U13 U14 U24 U25 = DRV8711DCPR: IC MTR DRV BIPOLR 8-52V 38HTSSOP; Manufacturer: Texas Instruments; Output Current: 200mA; Output Voltage: 5V; Min Supply Voltage: 8V; Max Supply Voltage: 52V; Interface: SPI; Supply Current: 17mA; Supplier: Mouser; LCSC Part Number: C60013; Manufacturer Part Number: DRV8711DCPR; RoHS: Yes; Item Type: IC; Stock: 9050; Pricing: 1=4.97, 10=4.29, 50=4.29, 100=3.66, 1000=2.63, 10000=2.48 (USD); Mounting Technology: Surface Mount; Case/Package: HTSSOP; Pins: 38; Min Operating Temperature: -40°C; Max Operating Temperature: 85°C; Packaging: Tape and Reel; Package Quantity: 2000; Series: -; Radiation Hardening: No; Lead Free: Lead Free; RoHS Compliant: Yes; ComponentLink1URL: https://datasheet.ciiva.com/24016/slvsc40d-317294-24016712.pdf?src-supplier=Mouser; ComponentLink1Description: https://datasheet.ciiva.com/24016/slvsc40d-317294-24016712.pdf?src-supplier=Mouser
U15 = ADS1115IDGSR: IC ADC 16BIT SIGMA-DELTA 10VSSOP; Manufacturer: Texas Instruments; Interface: I2C; Number of Bits: 16; Sampling Rate: 860S/s; Number of A/D Converters: 1; Resolution: 16b; Polarity: Bipolar; Min Supply Voltage: 2V; Max Supply Voltage: 5.5V; Supply Type: Single; Conversion Rate: 0.86KS/s; Number of Inputs: 4; Integral Nonlinearity (INL): 1LSB; Power Dissipation: 900uW; Nominal Supply Current: 150uA; Number of Channels: 2; Supplier: Mouser; Supplier Part Number: 595-ADS1115IDGSR; Manufacturer Part Number: ADS1115IDGSR; RoHS: Yes; Category: Analog to Digital Converters (ADCs); Stock: 5925; Pricing: 1=5.44, 10=4.76, 50=4.76, 100=4.01, 1000=2.88, 10000=2.78 (USD); Case/Package: VSSOP; Pins: 10; Contact Plating: Gold; Min Operating Temperature: -40°C; Max Operating Temperature: 125°C; Package Quantity: 2500; Packaging: Tape and Reel; Number of Converters: 1; Max Supply Voltage (DC): 5.5V; Min Supply Voltage (DC): 2V; Series: -; Length: 3mm; Width: 3mm; Height: 1.07mm; Thickness: 1.02mm; Reach SVHC Compliant: No; Lead Free: Lead Free; RoHS Compliant: Yes; ComponentLink1URL: https://datasheet.ciiva.com/4031/47725463s8438921n7713-4031028.pdf?src-supplier=Arrow+Electronics; ComponentLink1Description: https://datasheet.ciiva.com/4031/47725463s8438921n7713-4031028.pdf?src-supplier=Arrow+Electronics; LCSC Part Number: C37593; Item Type: IC
U16-U23 U26-U33 = CSD88537ND: MOSFET 2N-CH 60V 15A 8SOIC; Manufacturer: Texas Instruments; Item Type: IC; Supplier: Mouser; LCSC Part Number: C117439; Manufacturer Part Number: CSD88537ND; RoHS: Yes; Stock: 24825; Pricing: 1=1.26, 10=1.03, 50=1.03, 100=0.8, 1000=0.552, 10000=0.494 (USD); ComponentLink1URL: https://datasheet.ciiva.com/29589/csd88537nd-29589985.pdf?src-supplier=Digikey; ComponentLink1Description: https://datasheet.ciiva.com/29589/csd88537nd-29589985.pdf?src-supplier=Digikey; ComponentLink2URL: https://datasheet.ciiva.com/46430/1857624-46430364.pdf?src-supplier=Element14; ComponentLink2Description: https://datasheet.ciiva.com/46430/1857624-46430364.pdf?src-supplier=Element14